# EAGLE design SMPS-DIN-LITE (EAGLE 9.6.2)
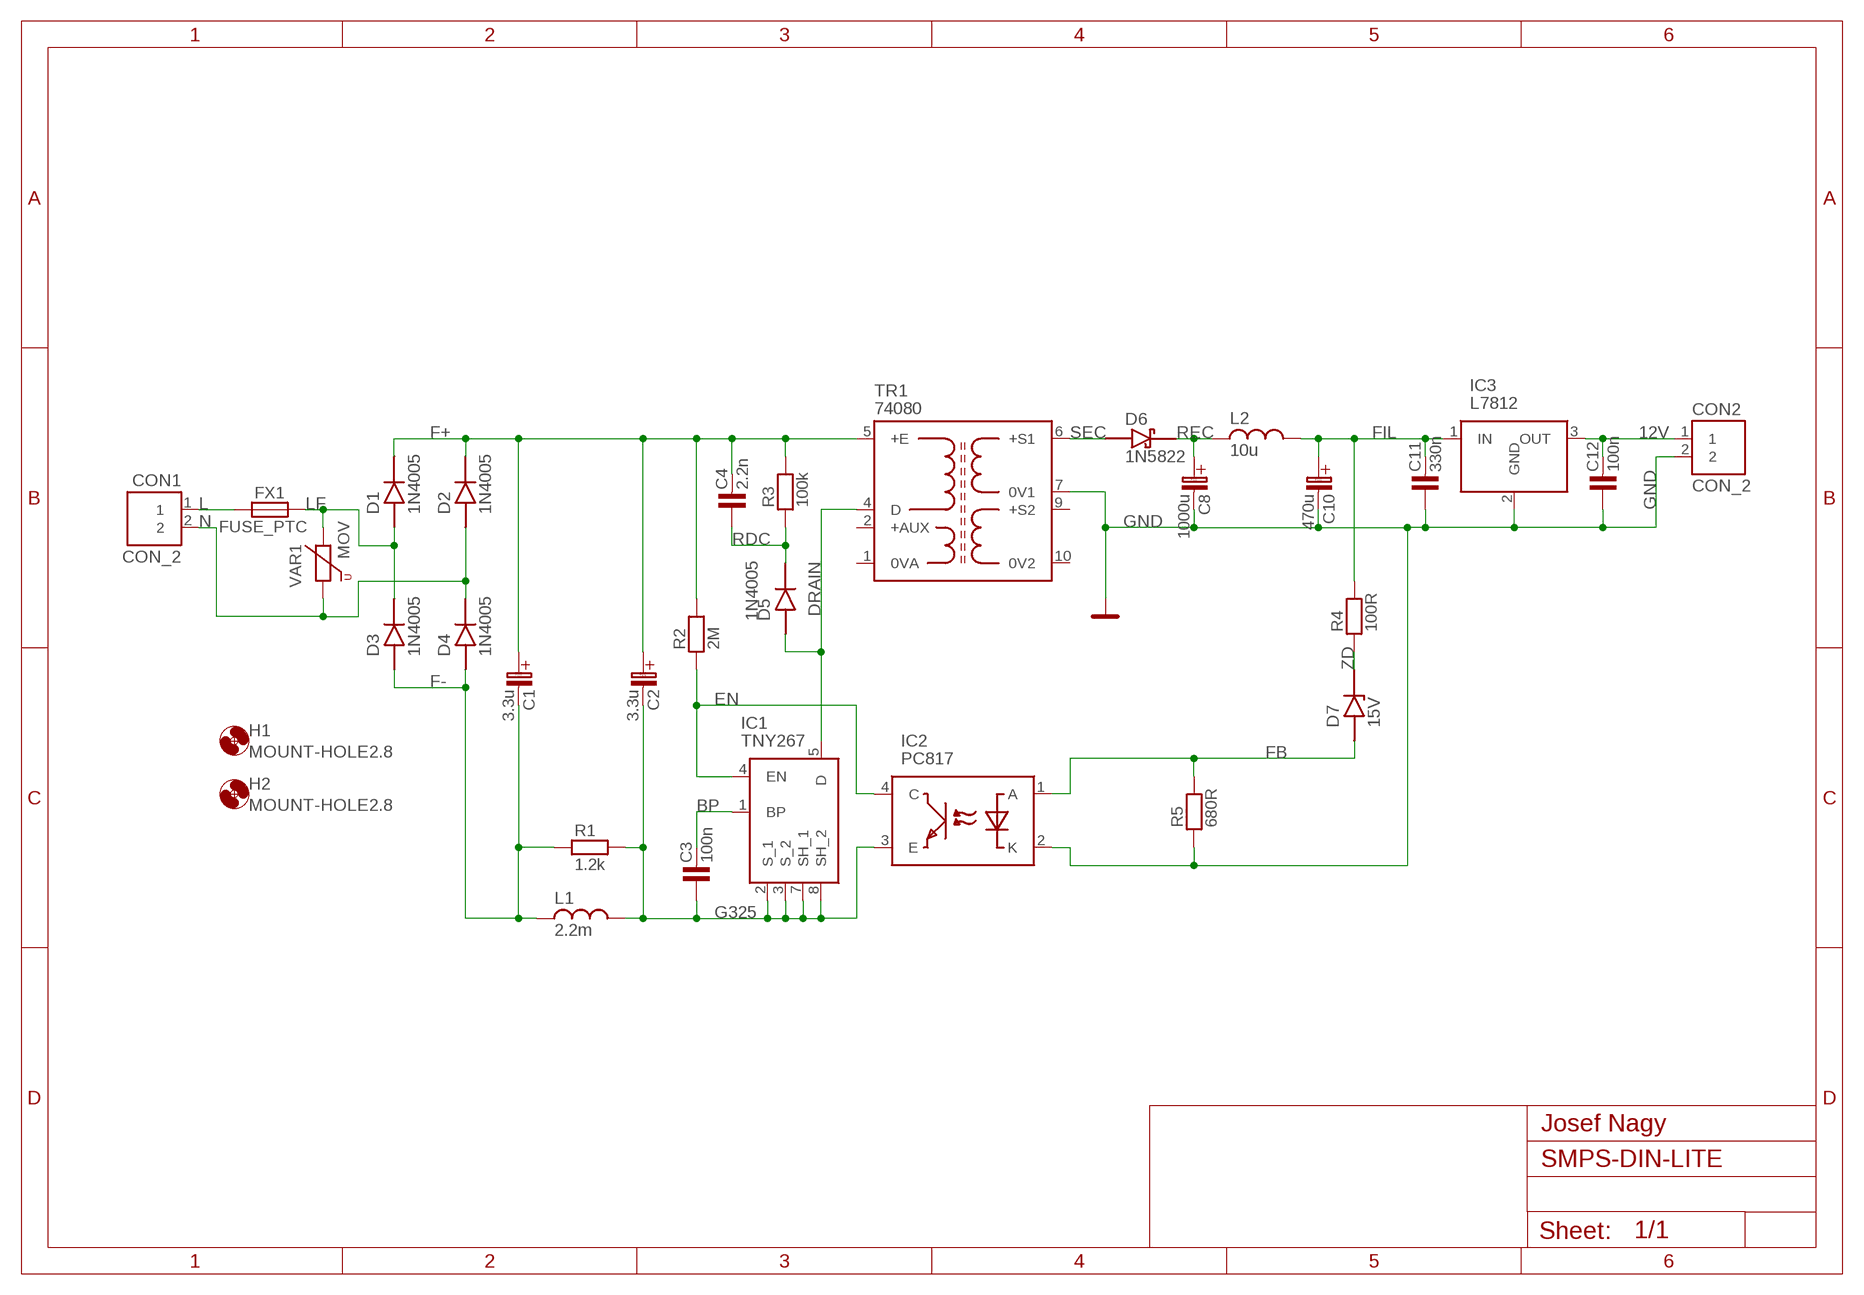
[diagram p0: schematic, sheet 1]

## Parts
C1  3.3u  C-EL_5  [C-EL_5]
C2  3.3u  C-EL_5  [C-EL_5]
C3  100n  C_KER_2,5  [C-2,5]
C4  2.2n  C_KER_10  [C-10]
C8  1000u  C-EL_5  [C-EL_5]
C10  470u  C-EL_5  [C-EL_5]
C11  330n  C_KER_5  [C-5]
C12  100n  C_KER_2,5  [C-2,5]
CON1  CON_2  [CON2]
CON2  CON_2  [CON2]
D1  1N4005  D_DO41V  [DO41_V]
D2  1N4005  D_DO41V  [DO41_V]
D3  1N4005  D_DO41V  [DO41_V]
D4  1N4005  D_DO41V  [DO41_V]
D5  1N4005  D_DO41V  [DO41_V]
D6  1N5822  D-SCHOTTKY_DO201V  [DO201_V]
D7  15V  D-ZENER_DO35V  [DO35_V]
FX1  FUSE_PTC  [FUSE_PTC]
H1  MOUNT-HOLE2.8  [2,8]
H2  MOUNT-HOLE2.8  [2,8]
IC1  TNY267  TNY267PN  [P-PACKAGE(DIP-8B)_1]
IC2  PC817  PC817X4NSZ1B  [DIP762W60P254L460H455Q4N]
IC3  L7812  L78XX  [TO255P460X1020X2008-3P]
L1  2.2m  L_5  [L-5]
L2  10u  L_3  [L-3]
R1  1.2k  R_STOJ  [R-STOJ]
R2  2M  R_STOJ2  [R-STOJ2]
R3  100k  R_STOJ  [R-STOJ]
R4  100R  R_STOJ  [R-STOJ]
R5  680R  R_STOJ  [R-STOJ]
TR1  74080  [74080]
VAR1  MOV  VARISTOR_1  [MOV_VARISTOR]

## Nets
12V: C12.2 CON2.1 IC3.3(OUT)
BP: C3.2 IC1.1(BP)
DRAIN: D5.A IC1.5(D) TR1.4(D)
EN: IC1.4(EN) IC2.4(C) R2.1
F+: C1.C+(C_EL+) C2.C+(C_EL+) C4.2 D1.K(C) D2.K(C) R2.2 R3.2 TR1.5(+E)
F-: C1.C-(C_EL-) D3.A D4.A L1.1 R1.1
FB: D7.A IC2.1(A) R5.2
FIL: C10.C+(C_EL+) C11.2 IC3.1(IN) L2.2 R4.2
G325: C2.C-(C_EL-) C3.1 IC1.2(S_1) IC1.3(S_2) IC1.7(SH_1) IC1.8(SH_2) IC2.3(E) L1.2 R1.2
GND: C8.C-(C_EL-) C10.C-(C_EL-) C11.1 C12.1 CON2.2 IC2.2(K) IC3.2(GND) R5.1 TR1.7(0V1)
L: CON1.1 FX1.1
LF: D1.A D3.K(C) FX1.2 VAR1.2
N: CON1.2 D2.A D4.K(C) VAR1.1
RDC: C4.1 D5.K(C) R3.1
REC: C8.C+(C_EL+) D6.K(C) L2.1
SEC: D6.A TR1.6(+S1)
ZD: D7.K(C) R4.1
Unconnected: TR1.1(0VA) TR1.2(+AUX) TR1.9(+S2) TR1.10(0V2)

## Notes on the sheet
- Josef Nagy

## Library data of the parts
C1 C2 C8 C10 = #_NG_knihovna:C-EL: Kondenzator - elektrolyticky
C3 C4 C11 C12 = #_NG_knihovna:C_KER: Kondenzator - keramicky
CON1 CON2 = #_NG_knihovna:CON_2
D1-D5 = #_NG_knihovna:D
D6 = #_NG_knihovna:D-SCHOTTKY; SPICEPREFIX: D
D7 = #_NG_knihovna:D-ZENER
FX1 = #_NG_knihovna:FUSE
H1 H2 = #_NG_knihovna:MOUNT-HOLE: MOUNTING HOLE with drill center marker
IC1 = #_NG_knihovna:TNY267PN: AC/DC Converters 12W 85-265 VAC 19W/230 VAC Source: Datasheet <https://componentsearchengine.com/Datasheets/1/TNY267PN.pdf>; DESCRIPTION: AC/DC Converters 12W 85-265 VAC 19W/230 VAC; HEIGHT: mm; MANUFACTURER_NAME: Power Integrations; MANUFACTURER_PART_NUMBER: TNY267PN
IC2 = #_NG_knihovna:PC817X4NSZ1B: Transistor Output Optocouplers OPTOISOLATOR 5KV TRANS DIP, Optoisolator Transistor Output 1 Channel Source: Datasheet <https://componentsearchengine.com/Datasheets/1/PC817X4NSZ1B.pdf>; DESCRIPTION: Transistor Output Optocouplers OPTOISOLATOR 5KV TRANS DIP, Optoisolator Transistor Output 1 Channel; HEIGHT: 4.55mm; MANUFACTURER_NAME: Sharp Microelectronics; MANUFACTURER_PART_NUMBER: PC817X4NSZ1B
IC3 = #_NG_knihovna:L78XX
L1 L2 = #_NG_knihovna:L
R1-R5 = #_NG_knihovna:R: Rezistor
TR1 = #_NG_knihovna:74080: Transformer: impulse; 185VAC,265VAC; 915V; 915V; 1.5A; 1.5A; PCB Source: Datasheet <https://www.tme.com/Document/74b1c6fdfa5c80edd28be424718b4d1b/74080.pdf>; DESCRIPTION: Transformer: impulse; 185VAC,265VAC; 915V; 915V; 1.5A; 1.5A; PCB; HEIGHT: 18mm; MANUFACTURER_NAME: MYRRA; MANUFACTURER_PART_NUMBER: 74080
VAR1 = #_NG_knihovna:VARISTOR

## Board
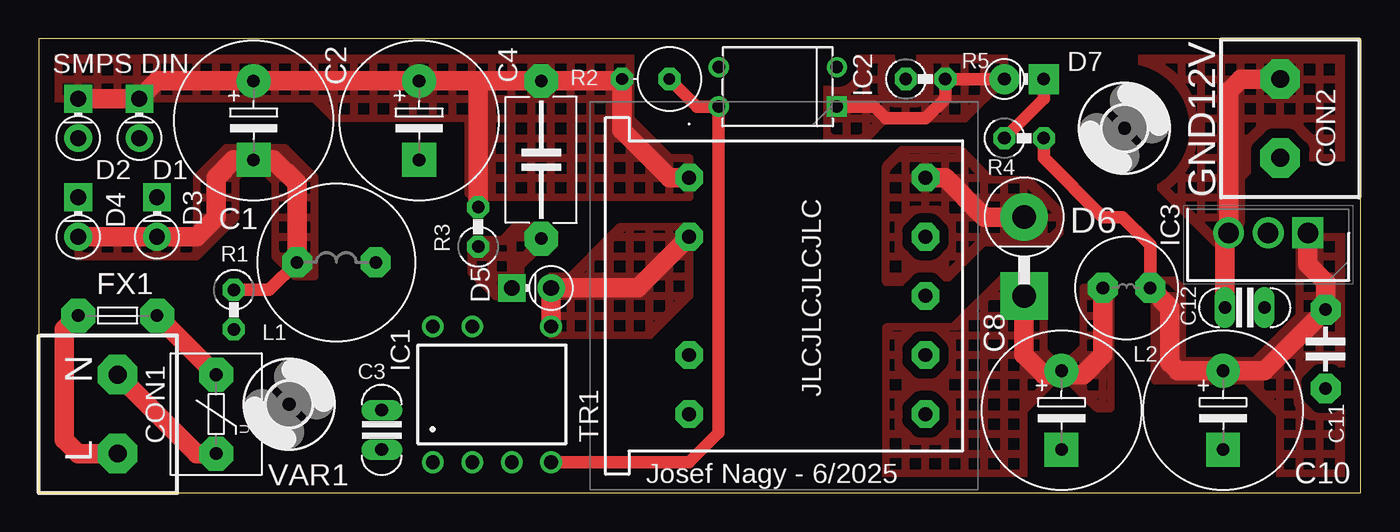
[diagram p1: board, top side]
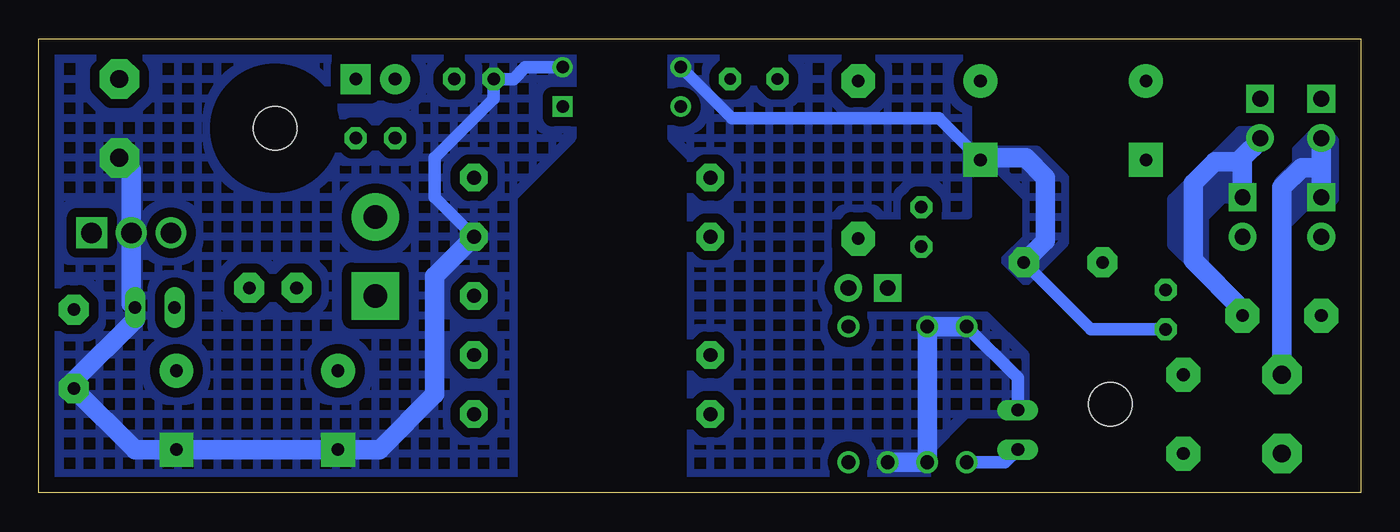
[diagram p2: board, bottom side, seen from below]

Size 85.2 x 29.26 mm. Coordinates in mm from the lower left corner, seen from the top.
Outline: 0,0 85.2,0 85.2,29.26 0,29.26 0,0
Copper layers (1*16): Top 0.035mm / dielectric 1.5mm / Bottom 0.035mm
Design rules "default": minimum track width 6mil, minimum drill 0.35mm, track to track 6mil, track to pad 6mil, pad to pad 6mil, via to via 6mil, smd to smd 6mil, copper to edge 40mil, drill to drill 6mil, minimum pad ring 10mil, minimum via ring 8mil, stop-mask expansion 4mil, vias tented up to drill 0mil, thermal gap 10mil

### Footprints (pad centres in the part's own frame; a part is rotated, then mirrored left to right if it is on the bottom)
C-EL_5 = drill 0.813 pad 2.184: C+ -2.54,0 | drill 0.813 pad 2.184 square: C- 2.54,0
C-2,5 = drill 0.813 pad 1.27 long: 1 -1.27,0; 2 1.27,0
C-10 = drill 0.813 pad 2.184 octagon: 1 -5.08,0; 2 5.08,0
C-5 = drill 0.813 pad 1.93 octagon: 1 -2.54,0; 2 2.54,0
CON2 = drill 1.143 pad 2.54 octagon: 1 -2.54,0; 2 2.54,0
DO41_V = drill 1.016 pad 1.778: A -1.27,0 | drill 1.016 pad 1.778 square: K 1.27,0
DO201_V = drill 1.524 pad 3.048: A -2.54,0 | drill 1.524 pad 3.048 square: K 2.54,0
DO35_V = drill 0.813 pad 1.93: A -1.27,0 | drill 0.813 pad 1.93 square: K 1.27,0
FUSE_PTC = drill 0.813 pad 2.184 octagon: 1 -2.54,0; 2 2.54,0
2,8 = hole 2.8: 0,0
P-PACKAGE(DIP-8B)_1 = drill 0.88 pad 1.4: 1 -3.81,-4.375; 2 -1.27,-4.375; 3 1.27,-4.375; 4 3.81,-4.375; 5 3.81,4.375; 7 -1.27,4.375; 8 -3.81,4.375
DIP762W60P254L460H455Q4N = drill 0.8 pad 1.27 square: 1 -3.81,1.27 | drill 0.8 pad 1.27: 2 -3.81,-1.27; 3 3.81,-1.27; 4 3.81,1.27
TO255P460X1020X2008-3P = drill 1.32 pad 1.98 square: 1 0,0 | drill 1.32 pad 1.98: 2 2.55,0; 3 5.1,0
L-5 = drill 0.813 pad 1.93 octagon: 1 -2.54,0; 2 2.54,0
L-3 = drill 0.813 pad 1.93 octagon: 1 -1.524,0; 2 1.524,0
R-STOJ = drill 0.813 pad 1.422 octagon: 1 -1.27,0; 2 1.27,0
R-STOJ2 = drill 0.75 pad 1.422 octagon: 1 -1.27,0; 2 1.778,0
74080 = drill 0.9 pad 1.778 octagon: 1 0,-15.24; 2 0,-11.43; 4 0,-3.81; 5 0,0; 6 15.24,0; 7 15.24,-3.81; 8 15.24,-7.62; 9 15.24,-11.43; 10 15.24,-15.24
MOV_VARISTOR = drill 0.813 pad 2.184 octagon: 1 -2.54,0; 2 2.54,0

### Placement (x,y rotation side)
C1  13.84,24 270 top
C2  24.51,24 270 top
C3  22.1,4.06 270 top
C4  32.38,21.46 90 top
C8  65.91,5.33 270 top
C10  76.33,5.33 270 top
C11  82.93,9.27 90 top
C12  77.72,11.94 180 top
CON1  5.08,5.08 90 top
CON2  80.01,24.13 270 top
D1  6.48,24.13 90 top
D2  2.54,24.13 90 top
D3  7.62,17.78 90 top
D4  2.54,17.78 90 top
D5  31.75,13.21 180 top
D6  63.5,15.24 270 top
D7  63.5,26.67 0 top
FX1  5.08,11.43 0 top
H1  16.13,5.71 0 top
H2  69.98,23.5 0 top
IC1  29.21,6.35 0 top
IC2  47.62,26.16 180 top
IC3  81.79,16.76 180 top
L1  19.18,14.86 0 top
L2  70.1,13.21 0 top
R1  12.57,11.81 270 top
R2  39.37,26.67 180 top
R3  28.32,17.14 90 top
R4  63.5,22.86 0 top
R5  57.15,26.67 0 top
TR1  41.91,20.32 0 top
VAR1  11.43,5.08 90 top

### Tracks (layer width: path | path; a pad name or v marks a point on that pad's centre or on a via)
12V
  Top 1.27: C12.2 76.45,16.53 | IC3.3 76.69,25.89 77.47,26.67 CON2.1
  pour Top (isolate 0.61, no thermals, hatched): 76.58,16.13 75.82,16.13 74.68,17.27 71.12,20.83 71.12,29.21 85.09,29.21 85.09,24.13 85.09,21.59 78.74,21.59 77.47,20.32 77.47,17.78 77.47,16.76 77.47,16.64 76.96,16.13
BP
  Bottom 0.813: C3.2 22.92,1.98 IC1.1
DRAIN
  Top 1.27: TR1.4 38.61,13.21 D5.A IC1.5
  pour Top (isolate 0.61, no thermals, hatched): 41.91,16.51 41.91,15.24 41.91,12.7 39.37,10.16 33.02,10.16 33.02,13.97 34.29,13.97 36.83,16.51 37.47,17.14 41.91,17.14
EN
  Top 0.813: R2.1 42.42,24.89 IC2.4 43.81,3.88 41.91,1.98 IC1.4
F+
  Top 1.27: D2.K D1.K 7.62,26.54 C1.C+ C2.C+ 28.57,26.54 | 28.57,26.54 C4.2 37.47,26.54 R2.2 37.59,23.37 40.64,20.32 TR1.5 | R3.2 28.32,26.29 28.57,26.54
  pour Top (isolate 0.61, no thermals, hatched): 38.1,29.21 38.1,24.13 40.64,21.59 41.91,21.59 41.91,19.05 28.7,19.05 28.32,18.67 27.69,19.3 27.69,24 27.56,24.13 19.05,24.13 17.78,25.4 0,25.4 0,29.21
F-
  Top 0.813: R1.1 14.86,13.08 L1.1
  Top 1.27: D4.A D3.A 10.16,16.51 11.43,17.78 11.43,20.32 12.57,21.46 C1.C- 15.11,21.46 16.64,19.94 L1.1
  pour Top (isolate 0.61, no thermals, hatched): 2.54,16.51 2.54,15.24 10.16,15.24 12.7,17.78 12.7,20.32 13.08,20.7 14.61,20.7 14.86,20.45 15.24,20.07 15.24,15.24 16.51,13.97 17.78,13.97 17.78,20.32 15.88,22.23 12.06,22.23 10.16,20.32 10.16,17.78 10.16,16.51
FB
  Top 0.813: D7.A R5.2 58.42,25.4 57.15,24.13 54.61,24.13 53.85,24.89 IC2.1
  pour Top (isolate 0.61, no thermals, hatched): 50.8,29.21 50.8,22.86 53.34,22.86 54.61,24.13 59.69,24.13 62.23,26.67 62.23,29.21
FIL
  Top 0.813: L2.2 71.63,16 69.85,17.78 68.58,17.78 64.77,21.59 R4.2
  Top 1.27: L2.2 72.9,11.94 72.9,8.38 73.41,7.87 C10.C+ 78.99,7.87 C11.2 82.93,13.59 81.79,14.73 IC3.1
  pour Top (isolate 0.61, no thermals, hatched): 71.63,13.72 73.15,13.72 73.66,13.21 73.66,8.51 78.36,8.51 81.28,11.43 81.28,16.51 85.09,16.51 85.09,0 80.01,0 80.01,5.08 77.85,7.24 71.93,7.24 71.93,13.41
G325
  Bottom 0.813: IC2.3 40.51,24.13 27.18,24.13 C2.C- | C3.1 22.1,7.42 IC1.8 | R1.2 17.4,10.54 L1.2
  Bottom 1.27: IC1.3 IC1.2 IC1.7 IC1.8 | L1.2 20.32,16.26 20.32,20.32 21.59,21.59 24.38,21.59 C2.C-
  pour Bottom (isolate 0.61, no thermals, hatched): 44.45,29.21 44.45,22.86 43.18,21.59 43.18,0 27.94,0 27.94,2.54 25.4,5.08 21.59,5.08 21.59,8.89 24.13,11.43 34.29,11.43 34.29,17.91 25.27,17.91 25.27,29.21
  pour Bottom (isolate 0.61, no thermals, hatched): 21.59,13.59 19.05,16.13 19.05,20.32 20.83,22.1 23.62,22.1 24.13,21.59 21.59,19.05 21.59,16.38 22.99,14.99
GND
  Bottom 0.813: IC2.2 53.85,27.43 54.61,26.67 R5.1 55.88,25.4 59.69,21.59 59.69,19.05 TR1.7
  Bottom 1.27: CON2.2 79.24,20.82 IC3.2 79.24,12.18 C12.1 78.99,11.18 82.93,7.24 C11.1 78.99,2.79 C10.C- C8.C- 63.25,2.79 59.69,6.35 59.69,13.97 TR1.7
  pour Bottom (isolate 0.61, no thermals, hatched): 50.8,29.21 50.8,22.86 54.61,19.05 54.61,16.51 54.61,0 85.09,0 85.09,29.21
L
  Top 1.27: FX1.1 1.65,10.54 1.65,3.43 2.54,2.54 CON1.1
LF
  Top 1.27: FX1.2 VAR1.2
  Bottom 1.27: D1.A 6.48,22.73 7.62,21.59 7.62,21.34 | 7.62,21.34 D3.K | FX1.2 7.62,11.81 10.79,14.99 10.79,19.94 9.4,21.34 7.62,21.34
  pour Bottom (isolate 0.61, no thermals): 6.35,22.86 7.62,21.59 7.62,19.05 8.89,19.05 10.16,17.78 10.16,17.65 10.16,14.61 10.67,14.61 12.06,16 12.06,18.92 9.27,21.72 7.75,23.24 6.35,23.24
N
  Top 1.27: VAR1.1 10.16,2.54 CON1.2
  Bottom 1.27: D2.A 2.54,20.95 | 2.54,20.95 D4.K | 2.54,20.95 3.81,20.95 5.08,19.68 CON1.2
  pour Bottom (isolate 0.61, no thermals): 4.57,17.4 3.43,18.54 2.54,18.54 2.03,18.54 1.65,18.92 1.65,22.73 2.16,23.24 3.05,23.24 4.19,22.1 4.19,21.21 5.33,20.07 5.33,17.4
RDC
  pour Top (isolate 0.61, no thermals, hatched): 30.48,12.7 29.46,12.7 28.07,14.1 27.94,14.22 27.94,16 28.19,16.26 28.45,16.26 29.21,16.26 29.84,16.26 30.73,17.14 32.64,17.14 33.15,16.64 33.15,16 32.77,15.62 32,15.62 30.99,14.61 30.99,12.7
REC
  Top 1.27: D6.K 63.5,8.89 64.77,7.62 65.66,7.62 C8.C+ 66.17,7.62 67.31,7.62 68.58,8.89 L2.1
  pour Top (isolate 0.61, no thermals, hatched): 64.77,13.97 62.23,13.97 58.93,10.67 54.61,10.67 54.61,0 63.5,0 63.5,5.33 65.41,7.24 66.42,7.24 68.2,5.46 69.09,5.46 69.09,13.21 67.31,13.21 67.31,9.4 66.42,8.51 65.41,8.51 64.77,9.14
SEC
  Top 1.27: TR1.6 58.42,20.32 60.96,17.78 D6.A
  pour Top (isolate 0.61, no thermals, hatched): 54.61,13.59 54.61,21.08 55.63,22.1 59.44,22.1 61.34,20.19 63.75,20.19 65.79,18.16 65.79,16.76 65.15,16.13 60.83,16.13 58.29,13.59
ZD
  Top 0.813: D7.K 64.77,25.4 R4.1

### Text on the board
tPlace: SMPS DIN | JLCJLCJLCJLC | Josef Nagy - 6/2025
tNames: 12V | GND | N | L